# Altium schematic sheet DeepBCI_ws2812.SchDoc
size A4
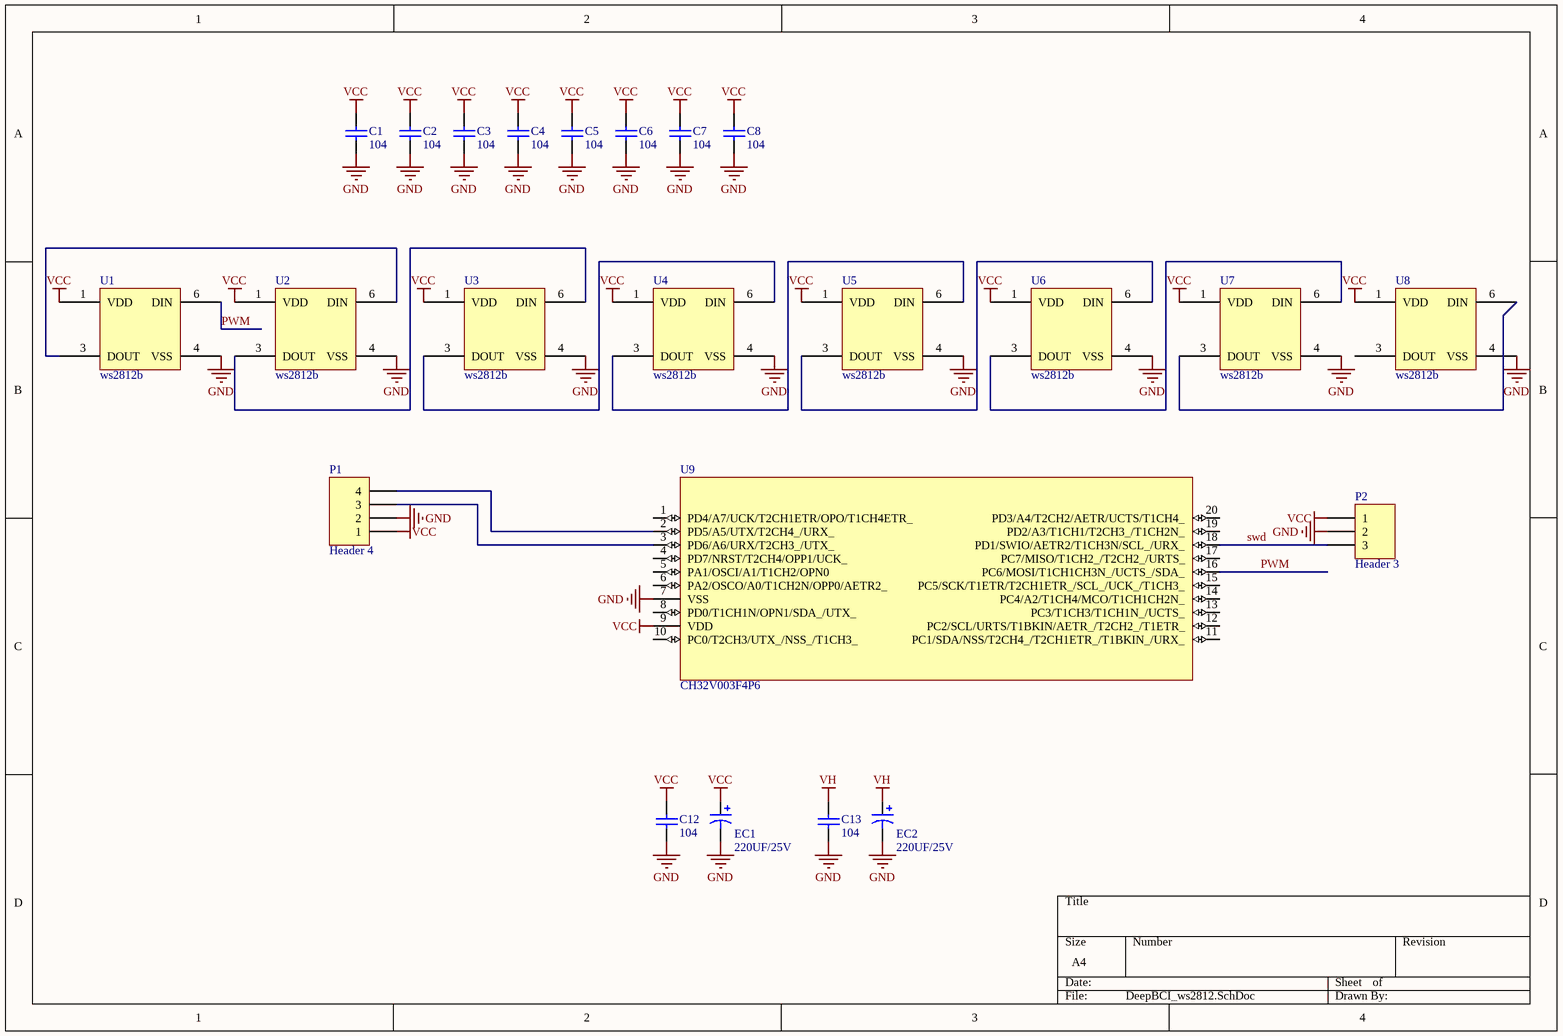
[diagram p0: DeepBCI_ws2812.SchDoc]

## Parts
C1  104  [CAPC_0603_2]
C2  104  [CAPC_0603_2]
C3  104  [CAPC_0603_2]
C4  104  [CAPC_0603_2]
C5  104  [CAPC_0603_2]
C6  104  [CAPC_0603_2]
C7  104  [CAPC_0603_2]
C8  104  [CAPC_0603_2]
C12  104  [CAPC_0603_2]
C13  104  [CAPC_0603_2]
EC1  220UF/25V  [CAP_3528_B]
EC2  220UF/25V  [CAP_3528_B]
P1  Header 4  [HDR1X4]
P2  Header 3  [HDR1X3]
U1  ws2812b  [WS2812_5050]
U2  ws2812b  [WS2812_5050]
U3  ws2812b  [WS2812_5050]
U4  ws2812b  [WS2812_5050]
U5  ws2812b  [WS2812_5050]
U6  ws2812b  [WS2812_5050]
U7  ws2812b  [WS2812_5050]
U8  ws2812b  [WS2812_5050]
U9  CH32V003F4P6  [TSSOP_20]

## Nets
GND: C1.2 C2.2 C3.2 C4.2 C5.2 C6.2 C7.2 C8.2 C12.2 C13.2 EC1.2 EC2.2 P1.2 P2.2 U1.4(VSS) U2.4(VSS) U3.4(VSS) U4.4(VSS) U5.4(VSS) U6.4(VSS) U7.4(VSS) U8.4(VSS) U9.7(VSS)
VCC: C1.1 C2.1 C3.1 C4.1 C5.1 C6.1 C7.1 C8.1 C12.1 EC1.1 P1.1 P2.1 U1.1(VDD) U2.1(VDD) U3.1(VDD) U4.1(VDD) U5.1(VDD) U6.1(VDD) U7.1(VDD) U8.1(VDD) U9.9(VDD)
VH: C13.1 EC2.1
PWM: U1.6(DIN) U9.16(PC6/MOSI/T1CH1CH3N_/UCTS_/SDA_)
swd: P2.3 U9.18(PD1/SWIO/AETR2/T1CH3N/SCL_/URX_)
NetP1_3: P1.3 U9.3(PD6/A6/URX/T2CH3_/UTX_)
NetP1_4: P1.4 U9.2(PD5/A5/UTX/T2CH4_/URX_)
NetU1_3: U1.3(DOUT) U2.6(DIN)
NetU2_3: U2.3(DOUT) U3.6(DIN)
NetU3_3: U3.3(DOUT) U4.6(DIN)
NetU4_3: U4.3(DOUT) U5.6(DIN)
NetU5_3: U5.3(DOUT) U6.6(DIN)
NetU6_3: U6.3(DOUT) U7.6(DIN)
NetU7_3: U7.3(DOUT) U8.6(DIN)

Not connected (* = marked no-connect by the designer): U8 3(DOUT); U9 1(PD4/A7/UCK/T2CH1ETR/OPO/T1CH4ETR_) 4(PD7/NRST/T2CH4/OPP1/UCK_) 5(PA1/OSCI/A1/T1CH2/OPN0) 6(PA2/OSCO/A0/T1CH2N/OPP0/AETR2_) 8(PD0/T1CH1N/OPN1/SDA_/UTX_) 10(PC0/T2CH3/UTX_/NSS_/T1CH3_) 11(PC1/SDA/NSS/T2CH4_/T2CH1ETR_/T1BKIN_/URX_) 12(PC2/SCL/URTS/T1BKIN/AETR_/T2CH2_/T1ETR_) 13(PC3/T1CH3/T1CH1N_/UCTS_) 14(PC4/A2/T1CH4/MCO/T1CH1CH2N_) 15(PC5/SCK/T1ETR/T2CH1ETR_/SCL_/UCK_/T1CH3_) 17(PC7/MISO/T1CH2_/T2CH2_/URTS_) 19(PD2/A3/T1CH1/T2CH3_/T1CH2N_) 20(PD3/A4/T2CH2/AETR/UCTS/T1CH4_)

## Library data of the parts
C1-C8 C12 C13 = Cap: Capacitor; Value: 0.1UF; Published: 8-Jun-2000; LatestRevisionDate: 17-Jul-2002; LatestRevisionNote: Re-released for DXP Platform.; PackageReference: RAD-0.3; Publisher: Altium Limited
EC1 EC2 = Cap Pol3: Polarized Capacitor (Surface Mount); Value: 220UF; Published: 8-Jun-2000; LatestRevisionDate: 17-Jul-2002; LatestRevisionNote: Re-released for DXP Platform.; PackageReference: C0805; Publisher: Altium Limited
P1 = Header 4: Header, 4-Pin; LatestRevisionDate: 17-Jul-2002; LatestRevisionNote: Re-released for DXP Platform.; Publisher: Altium Limited
P2 = Header 3: Header, 3-Pin; LatestRevisionDate: 17-Jul-2002; LatestRevisionNote: Re-released for DXP Platform.; Publisher: Altium Limited
U9 = CH32V003F4P6: RISC-V MCU, 48MHz